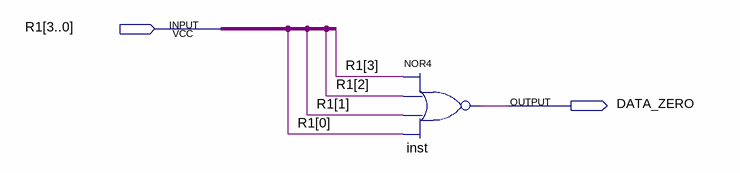
[diagram p0: schematic sheet]
// Quartus schematic DATA_ZERO.bdf as structural Verilog: 1 symbols, 2 pins
module DATA_ZERO (
  input  [3:0] R1,
  output DATA_ZERO
);

  nor inst (DATA_ZERO, R1[3], R1[2], R1[1], R1[0]);
endmodule
